# Altium schematic sheet SMPS.SchDoc
size Letter; SheetNumber: 13; SheetTotal: 15
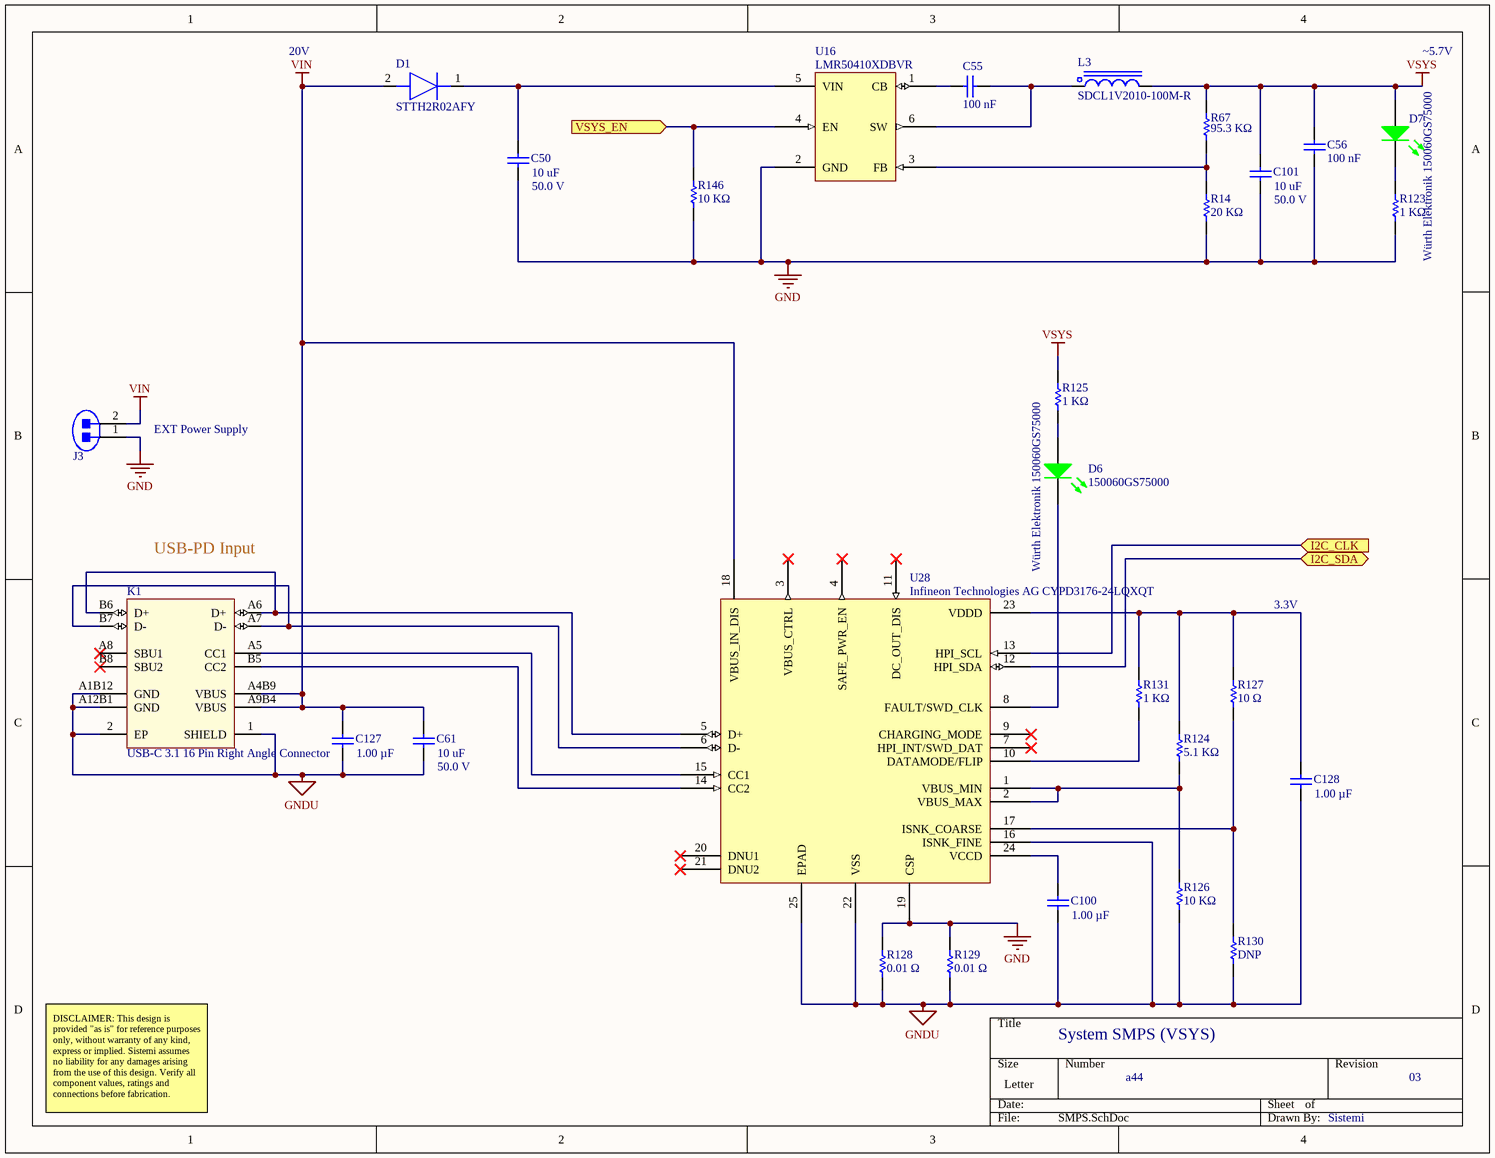
[diagram p0: SMPS.SchDoc]

## Parts
C50  Capacitance: 10 uF  Voltage Rating (DC): 50.0 V  [CAPC3216X180X55LL20T25]  (hidden comment: Murata GRM31CR61H106KA12L)
C55  Capacitance: 100 nF  [CAPC1005X56X25NL10T15]  (hidden comment: Samsung CL05B104KO5NNNC)
C56  Capacitance: 100 nF  [CAPC1005X56X25NL10T15]  (hidden comment: Samsung CL05B104KO5NNNC)
C61  Capacitance: 10 uF  Voltage Rating (DC): 50.0 V  [CAPC3216X180X55LL20T25]  (hidden comment: Murata GRM31CR61H106KA12L)
C100  Capacitance: 1.00 µF  [CAPC1608X90X35NL15T15]  (hidden comment: Samsung CL10B105KA8NNNC)
C101  Capacitance: 10 uF  Voltage Rating (DC): 50.0 V  [CAPC3216X180X55LL20T25]  (hidden comment: Murata GRM31CR61H106KA12L)
C127  Capacitance: 1.00 µF  [CAPC1608X90X35NL15T15]  (hidden comment: Samsung CL10B105KA8NNNC)
C128  Capacitance: 1.00 µF  [CAPC1608X90X35NL15T15]  (hidden comment: Samsung CL10B105KA8NNNC)
D1  STTH2R02AFY  [SODFL4724X103N]
D6  Würth Elektronik 150060GS75000  Manufacturer Part Number: 150060GS75000  [PCB-5fu3j7c0qqekthrt71i6-1]
D7  Würth Elektronik 150060GS75000  [PCB-5fu3j7c0qqekthrt71i6-1]
J3  TE Connectivity / AMP 5-146280-2  [PCB-nx47vqovjjduu8dkc1uz-1]  (value not drawn)
K1  USB-C 3.1 16 Pin Right Angle Connector  [PCB-ld6ppm2v3fcnldhcn63r-1]
L3  SDCL1V2010-100M-R  [PCB-3ir64hapazioc2jy0mm2-1]
R14  Resistance: 20 KΩ  [RESC1608X55X30ML15T15]  (hidden comment: Generic RES 0603)
R67  Resistance: 95.3 KΩ  [RESC1005X40X25NL05T05]  (hidden comment: 95.3 KΩ,±1%,0402)
R123  Resistance: 1 KΩ  [RESC1608X55X30ML15T15]  (hidden comment: Generic RES 0603)
R124  Resistance: 5.1 KΩ  [RESC1608X55X30ML15T15]  (hidden comment: Generic RES 0603)
R125  Resistance: 1 KΩ  [RESC1608X55X30ML15T15]  (hidden comment: Generic RES 0603)
R126  Resistance: 10 KΩ  [RESC1608X55X30ML15T15]  (hidden comment: Generic RES 0603)
R127  Resistance: 10 Ω  [RESC1005X40X25NL05T05]  (hidden comment: 10 Ω,±1%,0402)
R128  Resistance: 0.01 Ω  [RESC1005X40X25NL05T05]  (hidden comment: 0.01 Ω,±1%,0402)
R129  Resistance: 0.01 Ω  [RESC1005X40X25NL05T05]  (hidden comment: 0.01 Ω,±1%,0402)
R130  Resistance: DNP  [RESC1608X55X30ML15T15]  (hidden comment: Generic RES 0603)
R131  Resistance: 1 KΩ  [RESC1608X55X30ML15T15]  (hidden comment: Generic RES 0603)
R146  Resistance: 10 KΩ  [RESC1608X55X30LL15T15]  (hidden comment: Generic RES 0603)
U16  LMR50410XDBVR  [PCB-b726so6zuq7w9f75ocqz-1]
U28  Infineon Technologies AG CYPD3176-24LQXQT  [QFN-24_N]

## Ports
I2C_CLK (in), I2C_SDA (bidir), VSYS_EN (in)

## Nets
GND: C50.1 C56.2 C101.1 J3.1 R14.1 R123.1 R128.2 R129.2 R146.1 U16.2(GND) U28.19(CSP)
GNDU: C61.1 C100.1 C127.1 C128.1 K1.1(SHIELD) K1.2(EP) K1.A1B12(GND) K1.A12B1(GND) R126.1 R128.1 R129.1 R130.1 U28.16(ISNK_FINE) U28.22(VSS) U28.25(EPAD)
VIN: C61.2 C127.2 D1.2(A) J3.2 K1.A4B9(VBUS) K1.A9B4(VBUS) U28.18(VBUS_IN_DIS)
VSYS: C56.1 C101.2 D7.2(A) L3.1 R67.2 R125.2
I2C_CLK: U28.13(HPI_SCL) ; port I2C_CLK
I2C_SDA: U28.12(HPI_SDA) ; port I2C_SDA
VSYS_EN: R146.2 U16.4(EN) ; port VSYS_EN
NetC50_2: C50.2 D1.1(K) U16.5(VIN)
NetC55_1: C55.1 L3.2 U16.6(SW)
NetC55_2: C55.2 U16.1(CB)
NetC100_2: C100.2 U28.24(VCCD)
NetC128_2: C128.2 R124.2 R127.1 R131.2 U28.23(VDDD)
NetD6_1: D6.1(K) U28.8(FAULT/SWD_CLK)
NetD6_2: D6.2(A) R125.1
NetD7_1: D7.1(K) R123.2
NetK1_A5: K1.A5(CC1) U28.15(CC1)
NetK1_A6: K1.A6(D+) K1.B6(D+) U28.5(D+)
NetK1_A7: K1.A7(D-) K1.B7(D-) U28.6(D-)
NetK1_B5: K1.B5(CC2) U28.14(CC2)
NetR14_2: R14.2 R67.1 U16.3(FB)
NetR124_1: R124.1 R126.2 U28.1(VBUS_MIN) U28.2(VBUS_MAX)
NetR127_2: R127.2 R130.2 U28.17(ISNK_COARSE)
NetR131_1: R131.1 U28.10(DATAMODE/FLIP)

Not connected (* = marked no-connect by the designer): K1 A8(SBU1)* B8(SBU2)*; U28 3(VBUS_CTRL)* 4(SAFE_PWR_EN)* 7(HPI_INT/SWD_DAT)* 9(CHARGING_MODE)* 11(DC_OUT_DIS)* 20(DNU1)* 21(DNU2)*

## Notes on the sheet
- 20V
- ~5.7V
- EXT Power Supply
- USB-PD Input
- 3.3V
- System SMPS (VSYS)
- DISCLAIMER: This design is provided "as is" for reference purposes only, without warranty of any kind, express or implied. Sistemi assumes no liability for any damages arising from the use of this design. Verify all component values, ratings and connections before fabrication.
- a44
- 03
- Sistemi

## Library data of the parts
C50 C61 C101 = CMP-3554908-2: Multilayer Ceramic Capacitors MLCC - SMD/SMT 1206 10uF 50volt X5R +/-10%; Manufacturer Part Number: CL31B106KBHNNNE; Capacitance Tolerance: ±10%; Case/Package (SI): 3216; Lead-Free Status: Lead Free; Dielectric Characteristic: X5R; Lifecycle Status: Active; Mounting Style: Surface Mount; Number of Pins: 2; Octopart Url: https://octopart.com/grm31cr61h106ka12l-murata-18903335; OctopartID: fd8535afa9c42242; Packaging: Cut Tape (CT); REACH SVHC Compliance: No SVHC; RoHS: Compliant; Size-Length: 0.0032 m; Size-Thickness: 0.0016 m; Size-Width: 0.0016 m
C55 C56 = CMP-bf2276a55d9a60e5-19: Ceramic capacitor SMD-0402 100nF /16V X7R# K +-10%, Samsung, RoHS; Dielectric Characteristic: X7R; Lead-Free Status: Lead Free; Voltage Rating (DC): 16.0 V; Capacitance Tolerance: ±10%; Mounting Style: Surface Mount; Case/Package: 0402; OctopartID: 0755ced2c795d892; Footprint: PCB-0002-00476-3; Octopart URL: https://octopart.com/cl05b104ko5nnnc-samsung-9299366; RoHS: Compliant; Manufacturer Part Number: CL05B104KO5NNNC
C100 C127 C128 = CMP-7473528-5: CL Series 0603 1 uF 25 V ±10 % X7R Surface Mount Multilayer Ceramic Capacitor; Manufacturer Part Number: UMK107AB7105KA-T; Lead-Free Status: Lead Free; Capacitance Tolerance: ±10%; Voltage Rating (DC): 25.0 V; RoHS: Compliant; Mounting Style: Surface Mount; Footprint: PCB-0002-00062-3; Octopart URL: http://octopart.com/cl10b105ka8nnnc-samsung-19831597; Case/Package: 0603; OctopartID: ce7a065e703111bd; Dielectric Characteristic: X7R
D1 = STTH2R02AFY: Diode; Manufacturer_Name: STMicroelectronics; Datasheet Link: https://www.st.com/resource/en/datasheet/stth2r02af-y.pdf; Height: 1.03mm; Manufacturer Part Number: STTH2R02AFY; Mouser Part Number: 511-STTH2R02AFY; Mouser Price/Stock: https://www.mouser.co.uk/ProductDetail/STMicroelectronics/STTH2R02AFY?qs=pZIKbki37pqpUMRfOtxSog%3D%3D; Arrow Part Number: STTH2R02AFY; Arrow Price/Stock: https://www.arrow.com/en/products/stth2r02afy/stmicroelectronics
D6 D7 = CMP-12518857-12: Led, Green, 520 Nm, 3.2 V, 30 Ma, 430 Mcd Rohs Compliant: Yes; Footprint: PCC-0029-00260-1
  D7: Manufacturer Part Number: 150060GS75000
J3 = CMP-876e4e6699ef58a9-5: 2 Positions Header, Unshrouded, Breakaway Connector 0.100" (2.54mm) Through Hole Gold; Vendor Part Number: A121480-ND; Manufacturer: TE Connectivity AMP Connectors; Vendor: Digikey; Number of Positions: 2; Contact Type: Male Pin; Octopart URL: http://octopart.com/5-146280-2-te+connectivity+%2F+amp-39436426; Contact Finish: Gold; HelpURL: http://www.te.com/commerce/DocumentDelivery/DDEController?Action=srchrtrv&DocNm=146280&DocType=Customer+Drawing&DocLang=English; Cost: 0.43; Contact Mating Length: 0.230" (5.84mm); Mounting Type: Through Hole; Family: Rectangular Connectors - Headers, Male Pins; Connector Type: Header, Unshrouded, Breakaway; Category: Connectors, Interconnects; Number of Rows: 1; Pitch: Header, Unshrouded, Breakaway; Manufacturer Part Number: 5-146280-2; Contact Finish Thickness: 15µin (0.38µm); OctopartID: 3545fe16d0a9ea82
K1 = CMP-qyb7yekqcd84h33ugas0-6: Manufacturer Part Number: USB4105-GF-A-120; ReplaceComponentId: NMLHXIMK; CustomComponentID: qyb7yekqcd84h33ugas0; PartId: 1
L3 = CMP-f0983e8c5bc42f5f-1: Inductor Power Semi-Shielded 10uH 20% 100KHz Ferrite 0.5A T/R; Octopart Url: https://octopart.com/sdcl1v2010-100m-r-cooper+bussmann-119443002; Manufacturer Part Number: SDCL1V2010-100M-R; OctopartID: f0983e8c5bc42f5f
R14 = CMP-0800c38b3cf2d7c7-3: Generic RES 0603, =Resistance+','+Tolerance+','+Case; Manufacturer Part Number: RT0603FRE1320KL; Case/Package (SI): 1608; Lead-Free Status: Lead Free; Power Rating: 63.0 mW; Voltage: 50V; ELV Compliant: Compliant; Tolerance: ±1%; Temperature Coefficient: -50.0 ppm/°C to 50.0 ppm/°C; Octopart URL: TBD; Number of Pins: 2; Mounting Style: Surface Mount; Packaging: Tape & Reel (TR); Lifecycle Status: Active; RoHS: Compliant; Case: 0603; Operating Temperature: -55.0 °C to 125 °C; REACH SVHC Compliance: No SVHC; Footprint: PCB-0002-00066-3; OctopartID: a8e96364fc37772e
R67 = CMP-3902036-3: Generic RES 0402, =Resistance+','+Tolerance+','+Case; Manufacturer Part Number: RC0402FR-0795K3L; Lead-Free Status: Lead Free; Voltage: 50.0 V; Power: 0.063 W; Mounting Style: Surface Mount; RoHS: Compliant; Number of Pins: 2; Tolerance: ±1%; Octopart Url: TBD; Case: 0402; OctopartID: 26dced8948c2f91b
R123 R125 R131 = CMP-0800c38b3cf2d7c7-3: Generic RES 0603, =Resistance+','+Tolerance+','+Case; Manufacturer Part Number: RT0603FRE071KL; Case/Package (SI): 1608; Lead-Free Status: Lead Free; Power Rating: 63.0 mW; Voltage: 50V; ELV Compliant: Compliant; Tolerance: ±1%; Temperature Coefficient: -50.0 ppm/°C to 50.0 ppm/°C; Octopart URL: TBD; Number of Pins: 2; Mounting Style: Surface Mount; Packaging: Tape & Reel (TR); Lifecycle Status: Active; RoHS: Compliant; Case: 0603; Operating Temperature: -55.0 °C to 125 °C; REACH SVHC Compliance: No SVHC; Footprint: PCB-0002-00066-3; OctopartID: a8e96364fc37772e
R124 = CMP-0800c38b3cf2d7c7-3: Generic RES 0603, =Resistance+','+Tolerance+','+Case; Manufacturer Part Number: RT0603FRE075K1L; Case/Package (SI): 1608; Lead-Free Status: Lead Free; Power Rating: 63.0 mW; Voltage: 50V; ELV Compliant: Compliant; Tolerance: ±1%; Temperature Coefficient: -50.0 ppm/°C to 50.0 ppm/°C; Octopart URL: TBD; Number of Pins: 2; Mounting Style: Surface Mount; Packaging: Tape & Reel (TR); Lifecycle Status: Active; RoHS: Compliant; Case: 0603; Operating Temperature: -55.0 °C to 125 °C; REACH SVHC Compliance: No SVHC; Footprint: PCB-0002-00066-3; OctopartID: a8e96364fc37772e
R126 R146 = CMP-0800c38b3cf2d7c7-3: Generic RES 0603, =Resistance+','+Tolerance+','+Case; Manufacturer Part Number: MCT06030C1002FP500; Case/Package (SI): 1608; Lead-Free Status: Lead Free; Power Rating: 63.0 mW; Voltage: 50V; ELV Compliant: Compliant; Tolerance: ±1%; Temperature Coefficient: -50.0 ppm/°C to 50.0 ppm/°C; Octopart URL: TBD; Number of Pins: 2; Mounting Style: Surface Mount; Packaging: Tape & Reel (TR); Lifecycle Status: Active; RoHS: Compliant; Case: 0603; Operating Temperature: -55.0 °C to 125 °C; REACH SVHC Compliance: No SVHC; Footprint: PCB-0002-00066-3; OctopartID: a8e96364fc37772e
R127 = CMP-3902036-3: Generic RES 0402, =Resistance+','+Tolerance+','+Case; Manufacturer Part Number: RT0402FRE0710RL; Lead-Free Status: Lead Free; Voltage: 50.0 V; Power: 0.063 W; Mounting Style: Surface Mount; RoHS: Compliant; Number of Pins: 2; Tolerance: ±1%; Octopart Url: TBD; Case: 0402; OctopartID: 26dced8948c2f91b
R128 R129 = CMP-3902036-3: Generic RES 0402, =Resistance+','+Tolerance+','+Case; Manufacturer Part Number: MFSA0402R0100FAM; Lead-Free Status: Lead Free; Voltage: 50.0 V; Power: 0.063 W; Mounting Style: Surface Mount; RoHS: Compliant; Number of Pins: 2; Tolerance: ±1%; Octopart Url: TBD; Case: 0402; OctopartID: 26dced8948c2f91b
R130 = CMP-0800c38b3cf2d7c7-3: Generic RES 0603, =Resistance+','+Tolerance+','+Case; Case/Package (SI): 1608; Lead-Free Status: Lead Free; Power Rating: 63.0 mW; Voltage: 50V; ELV Compliant: Compliant; Tolerance: ±1%; Temperature Coefficient: -50.0 ppm/°C to 50.0 ppm/°C; Octopart URL: TBD; Number of Pins: 2; Mounting Style: Surface Mount; Packaging: Tape & Reel (TR); Lifecycle Status: Active; RoHS: Compliant; Case: 0603; Operating Temperature: -55.0 °C to 125 °C; REACH SVHC Compliance: No SVHC; Footprint: PCB-0002-00066-3; OctopartID: a8e96364fc37772e
U16 = CMP-0f7bc0b79604d0bc-4: SIMPLE SWITCHER 4-V to 36-V, 1-A synchronous step-down converter 6-SOT-23 -40 to 150; Number of Outputs: 1; Switching Frequency: 700kHz (typ); Topology: Buck Converter; Output Current: 1.0A; Lead-Free Status: Lead Free; Input Voltage: 4.0V to 36.0V; Output Voltage: Adjustable (SW to GND: -0.3V to VIN+0.3V); case/package: SOT-23-6 DBV Package; Number of Pins: 6; Mounting Style: Surface Mount; Manufacturer Part Number: LMR50410XDBVR; Operating Temperature (Junction): -40°C to 150°C; Octopart URL: https://octopart.com/lmr50410xdbvr-texas+instruments-113687577; OctopartID: 0f7bc0b79604d0bc; Lifecycle Status: Not Listed by Manufacturer
U28 = CMP-66c0a8bd4ec7b907-1: Usb Type-C Pd Cntrl, -40 To 105Deg C Rohs Compliant: Yes; Manufacturer Part Number: CYPD3176-24LQXQT; Octopart Url: https://octopart.com/cypd3176-24lqxqt-infineon+technologies+ag-125242721; OctopartID: 66c0a8bd4ec7b907